# Altium schematic sheet TC264主板.SchDoc
size A3
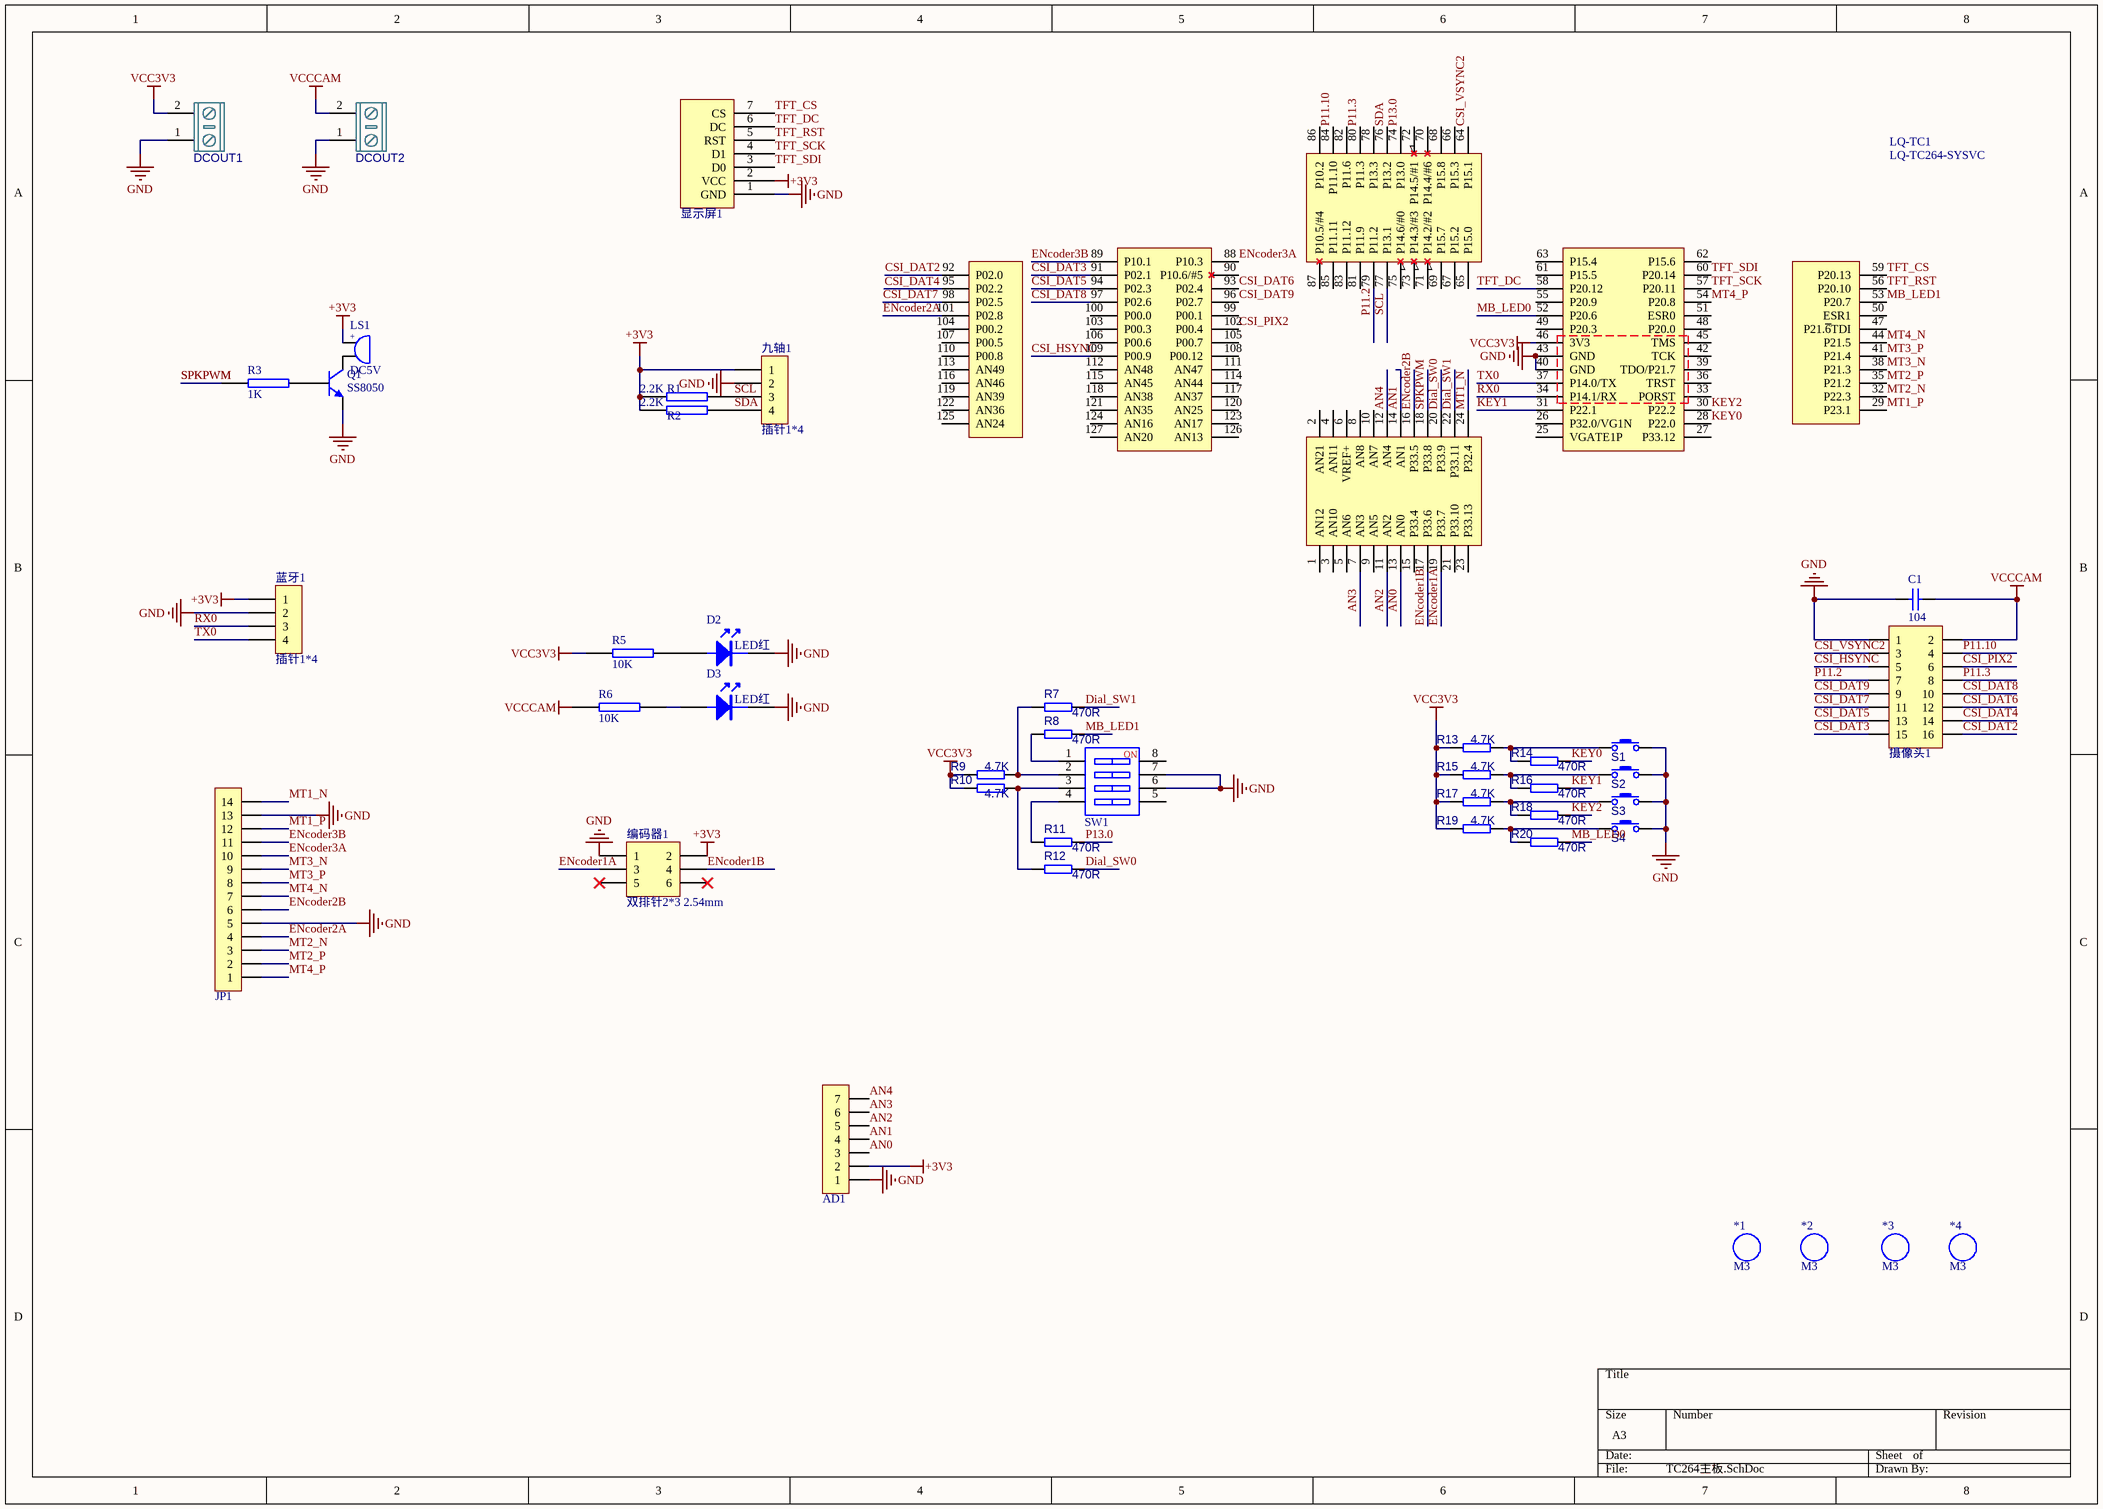
[diagram p0: TC264主板.SchDoc]

## Parts
*1  M3  [M3 125X200]
*2  M3  [M3 125X200]
*3  M3  [M3 125X200]
*4  M3  [M3 125X200]
AD1  HDR-1X7  [XH2.54-LI-7P]  (value not drawn)
C1  104  [LQ_C0603]
D2  LED红  [LQ_LED0603R]
D3  LED红  [LQ_LED0603R]
DCOUT1  KF/WJ/DG 30x connecter  [KF/WJ/DG 301-2p-5.0mm]  (value not drawn)
DCOUT2  KF/WJ/DG 30x connecter  [KF/WJ/DG 301-2p-5.0mm]  (value not drawn)
JP1  HDR-1X14  [XH2.54-LI-14P]  (value not drawn)
LQ-TC1  LQ-TC264-SYSVC  [LQ-TC264-SYSVC-S]
LS1  DC5V  [BEEP 5x9x5.5]
Q1  SS8050  [SOT23-3N]
R1  2.2K  [LQ_R0603]
R2  2.2K  [LQ_R0603]
R3  1K  [LQ_R0603]
R5  10K  [LQ_R0603]
R6  10K  [LQ_R0603]
R7  value 470R  [RESC1608[0603]S-N]  (hidden comment: 470R ±1%)
R8  value 470R  [RESC1608[0603]S-N]  (hidden comment: 470R ±1%)
R9  value 4.7K  [RESC1608[0603]S-N]  (hidden comment: 4.7K ±1%)
R10  value 4.7K  [RESC1608[0603]S-N]  (hidden comment: 4.7K ±1%)
R11  value 470R  [RESC1608[0603]S-N]  (hidden comment: 470R ±1%)
R12  value 470R  [RESC1608[0603]S-N]  (hidden comment: 470R ±1%)
R13  value 4.7K  [RESC1608[0603]S-N]  (hidden comment: 4.7K ±1%)
R14  value 470R  [RESC1608[0603]S-N]  (hidden comment: 470R ±1%)
R15  value 4.7K  [RESC1608[0603]S-N]  (hidden comment: 4.7K ±1%)
R16  value 470R  [RESC1608[0603]S-N]  (hidden comment: 470R ±1%)
R17  value 4.7K  [RESC1608[0603]S-N]  (hidden comment: 4.7K ±1%)
R18  value 470R  [RESC1608[0603]S-N]  (hidden comment: 470R ±1%)
R19  value 4.7K  [RESC1608[0603]S-N]  (hidden comment: 4.7K ±1%)
R20  value 470R  [RESC1608[0603]S-N]  (hidden comment: 470R ±1%)
S1  Button  [PTS810-3*4-CurvePin]  (value not drawn)
S2  Button  [PTS810-3*4-CurvePin]  (value not drawn)
S3  Button  [PTS810-3*4-CurvePin]  (value not drawn)
S4  Button  [PTS810-3*4-CurvePin]  (value not drawn)
SW1  DIP-SW-4P  [SW DIP-4P]  (value not drawn)
九轴1  插针1*4  [HDR2.54-LI-4P]
摄像头1  Header 8X2  [HDR2.54-LI-2x8P]  (value not drawn)
显示屏1  单排座1*7-2.54  [LQ-TFT-180V33]  (value not drawn)
编码器1  双排针2*3 2.54mm  [LQ_ENCODER]
蓝牙1  插针1*4  [HDR2.54-LI-4P]

## Nets
+3V3: AD1.2 LS1.1 R1.1 R2.1 九轴1.1 显示屏1.2(VCC) 编码器1.2 蓝牙1.1
GND: AD1.1 C1.1 D2.2 D3.2 DCOUT1.1 DCOUT2.1 JP1.5 JP1.13 LQ-TC1.40(GND) LQ-TC1.43(GND) Q1.2(E) S1.1 S2.1 S3.1 S4.1 SW1.6 SW1.7 九轴1.2 摄像头1.1 显示屏1.1(GND) 编码器1.1 蓝牙1.2
VCC3V3: DCOUT1.2 LQ-TC1.46(3V3) R5.1 R9.1 R10.1 R13.1 R15.1 R17.1 R19.1
VCCCAM: C1.2 DCOUT2.2 R6.1 摄像头1.2
AN0: AD1.3 LQ-TC1.13(AN0)
AN1: AD1.4 LQ-TC1.14(AN1)
AN2: AD1.5 LQ-TC1.11(AN2)
AN3: AD1.6 LQ-TC1.7(AN3)
AN4: AD1.7 LQ-TC1.12(AN4)
CSI_DAT2: LQ-TC1.92(P02.0) 摄像头1.16
CSI_DAT3: LQ-TC1.91(P02.1) 摄像头1.15
CSI_DAT4: LQ-TC1.95(P02.2) 摄像头1.14
CSI_DAT5: LQ-TC1.94(P02.3) 摄像头1.13
CSI_DAT6: LQ-TC1.93(P02.4) 摄像头1.12
CSI_DAT7: LQ-TC1.98(P02.5) 摄像头1.11
CSI_DAT8: LQ-TC1.97(P02.6) 摄像头1.10
CSI_DAT9: LQ-TC1.96(P02.7) 摄像头1.9
CSI_HSYNC: LQ-TC1.109(P00.9) 摄像头1.5
CSI_PIX2: LQ-TC1.102(P00.4) 摄像头1.6
CSI_VSYNC2: LQ-TC1.64(P15.1) 摄像头1.3
Dial_SW0: LQ-TC1.20(P33.9) R12.2
Dial_SW1: LQ-TC1.22(P33.11) R7.2
ENcoder1A: LQ-TC1.19(P33.7) 编码器1.3
ENcoder1B: LQ-TC1.17(P33.6) 编码器1.4
ENcoder2A: JP1.4 LQ-TC1.101(P02.8)
ENcoder2B: JP1.6 LQ-TC1.16(P33.5)
ENcoder3A: JP1.10 LQ-TC1.88(P10.3)
ENcoder3B: JP1.11 LQ-TC1.89(P10.1)
KEY0: LQ-TC1.28(P22.0) R14.2
KEY1: LQ-TC1.31(P22.1) R16.2
KEY2: LQ-TC1.30(P22.2) R18.2
MB_LED0: LQ-TC1.52(P20.6) R20.2
MB_LED1: LQ-TC1.53(P20.7) R8.2
MT1_N: JP1.14 LQ-TC1.24(P32.4)
MT1_P: JP1.12 LQ-TC1.29(P23.1)
MT2_N: JP1.3 LQ-TC1.32(P22.3)
MT2_P: JP1.2 LQ-TC1.35(P21.2)
MT3_N: JP1.9 LQ-TC1.38(P21.3)
MT3_P: JP1.8 LQ-TC1.41(P21.4)
MT4_N: JP1.7 LQ-TC1.44(P21.5)
MT4_P: JP1.1 LQ-TC1.54(P20.8)
P11.2: LQ-TC1.79(P11.2) 摄像头1.7
P11.3: LQ-TC1.80(P11.3) 摄像头1.8
P11.10: LQ-TC1.84(P11.10) 摄像头1.4
P13.0: LQ-TC1.74(P13.0) R11.2
RX0: LQ-TC1.34(P14.1/RX) 蓝牙1.3
SCL: LQ-TC1.77(P13.1) R1.2 九轴1.3
SDA: LQ-TC1.76(P13.2) R2.2 九轴1.4
SPKPWM: LQ-TC1.18(P33.8) R3.1
TFT_CS: LQ-TC1.59(P20.13) 显示屏1.7(CS)
TFT_DC: LQ-TC1.58(P20.12) 显示屏1.6(DC)
TFT_RST: LQ-TC1.56(P20.10) 显示屏1.5(RST)
TFT_SCK: LQ-TC1.57(P20.11) 显示屏1.4(D1)
TFT_SDI: LQ-TC1.60(P20.14) 显示屏1.3(D0)
TX0: LQ-TC1.37(P14.0/TX) 蓝牙1.4
NetD2_1: D2.1 R5.2
NetD3_1: D3.1 R6.2
NetLS1_2: LS1.2 Q1.3(C)
NetQ1_1: Q1.1(B) R3.2
NetR7_1: R7.1 R9.2 SW1.2
NetR8_1: R8.1 SW1.1
NetR10_2: R10.2 R12.1 SW1.3
NetR11_1: R11.1 SW1.4
NetR13_2: R13.2 R14.1 S1.2
NetR15_2: R15.2 R16.1 S2.2
NetR17_2: R17.2 R18.1 S3.2
NetR19_2: R19.2 R20.1 S4.2

Not connected (* = marked no-connect by the designer): LQ-TC1 1(AN12) 2(AN21) 3(AN10) 4(AN11) 5(AN6) 6(VREF+) 8(AN8) 9(AN5) 10(AN7) 15(P33.4) 21(P33.10) 23(P33.13) 25(VGATE1P) 26(P32.0/VG1N) 27(P33.12) 33(PORST) 36(TRST) 39(TDO/P21.7) 42(TCK) 45(TMS) 47(P21.~{6}TDI) 48(P20.0) 49(P20.3) 50(ESR1) 51(ESR0) 55(P20.9) 61(P15.5) 62(P15.6) 63(P15.4) 65(P15.0) 66(P15.3) 67(P15.2) 68(P15.8) 69(P15.7) 70(P14.4/#6) 71(P14.2/#2) 72(P14.5/#1) 73(P14.3/#3) 75(P14.6/#0) 78(P13.3) 81(P11.9) 82(P11.6) 83(P11.12) 85(P11.11) 86(P10.2) 87(P10.5/#4) 90(P10.6/#5) 99(P00.1) 100(P00.0) 103(P00.3) 104(P00.2) 105(P00.7) 106(P00.6) 107(P00.5) 108(P00.12) 110(P00.8) 111(AN47) 112(AN48) 113(AN49) 114(AN44) 115(AN45) 116(AN46) 117(AN37) 118(AN38) 119(AN39) 120(AN25) 121(AN35) 122(AN36) 123(AN17) 124(AN16) 125(AN24) 126(AN13) 127(AN20); SW1 5 8; 编码器1 5* 6*

## Notes on the sheet
- (in symbol BEEP) +
- (in symbol DIP-SW-4P) NO

## Library data of the parts
*1-*4 = M3: 铜柱孔; 联系卖家，免费查找封装: 唯一出售店铺网址https://shop463601444.taobao.com; 封装库来自淘宝卖家：黄晶宝石: 其他店铺购入均为盗版封装库，请立即申请退款，本店现金奖励200~1000元; BOM名称: 铜柱孔
AD1 = Header 7: 7P接插件; 联系卖家，免费查找封装: 唯一出售店铺网址https://shop463601444.taobao.com; 封装库来自淘宝卖家ID：黄晶宝石: 其他店铺购入均为盗版封装库，请立即申请退款，本店现金奖励50~200元; BOM名称: 7P接插件
C1 = Cap: Capacitor; Published: 8-Jun-2000; LatestRevisionDate: 17-Jul-2002; LatestRevisionNote: Re-released for DXP Platform.; PackageReference: RAD-0.3; Publisher: Altium Limited; PackageDescription: Radial Cap, Thru-Hole; 2 Leads; 0.3 in Pin Spacing; Value: 104
D2 D3 = LED
DCOUT1 DCOUT2 = KF/WJ/DG 30x: 接线端子 2Pin
JP1 = Header 14: 14P接插件; 联系卖家，免费查找封装: 唯一出售店铺网址https://shop463601444.taobao.com; 封装库来自淘宝卖家ID：黄晶宝石: 其他店铺购入均为盗版封装库，请立即申请退款，本店现金奖励50~200元; BOM名称: 14P接插件
LS1 = BEEP: 蜂鸣器; 联系卖家，免费查找封装: 唯一出售店铺网址https://shop463601444.taobao.com; 封装库来自淘宝卖家：黄晶宝石: 其他店铺购入均为盗版封装库，请立即申请退款，本店现金奖励200~1000元; BOM名称: 蜂鸣器
Q1 = 8050-SMD: 高频放大-NPN型; 参数: 40V 1.5A 1W 100MHZ; 8元以下特价购入的买家: 还可以联系卖家远程指导AD软件使用; BOM名称: 高频放大-NPN型
R1-R3 R5 R6 = RES2
R7 R8 R11 R12 R14 R16 R18 R20 = Res-Chip_11: 贴片电阻; Published: 8-Jun-2000; Revision: July-2002: Re-released for DXP Platform.; Tolerance: ±1%
R9 R10 R13 R15 R17 R19 = Res-Chip_4: 贴片电阻; Published: 8-Jun-2000; Revision: July-2002: Re-released for DXP Platform.; Tolerance: ±1%
S1-S4 = KEY: 按键; Published: 24-Mar-1999; Publisher: Altium Limited; Price(RMB): 0.000
SW1 = DIP-SW-4P: 4路编码开关; 联系卖家，免费查找封装: 唯一出售店铺网址https://shop463601444.taobao.com; 封装库来自淘宝卖家：黄晶宝石: 其他店铺购入均为盗版封装库，请立即申请退款，本店现金奖励200~1000元; BOM名称: 4路编码开关
九轴1 蓝牙1 = CON4: Connector
摄像头1 = Header 8X2: 8*2P接插件; 联系卖家，免费查找封装: 唯一出售店铺网址https://shop463601444.taobao.com; 封装库来自淘宝卖家ID：黄晶宝石: 其他店铺购入均为盗版封装库，请立即申请退款，本店现金奖励50~200元; BOM名称: 8*2P接插件
显示屏1 = LQ_OLED128X64
编码器1 = Header 3X2: Header, 3-Pin, Dual row; LatestRevisionDate: 17-Jul-2002; LatestRevisionNote: Re-released for DXP Platform.; Publisher: Altium Limited